# Altium schematic sheet Схема проверки шлейфа.SchDoc
size 594 x 420 mm; CheckedBy: Проверил; SheetNumber: 1; SheetTotal: 2; _Razrabotal: Рябышев; _Naimenovanie1: Стенд проверки шлейфов; _Naimenovanie4: v1.0; _Predprijatie: ООО "ПРОТОН"; _List: 1; _Listov: 2
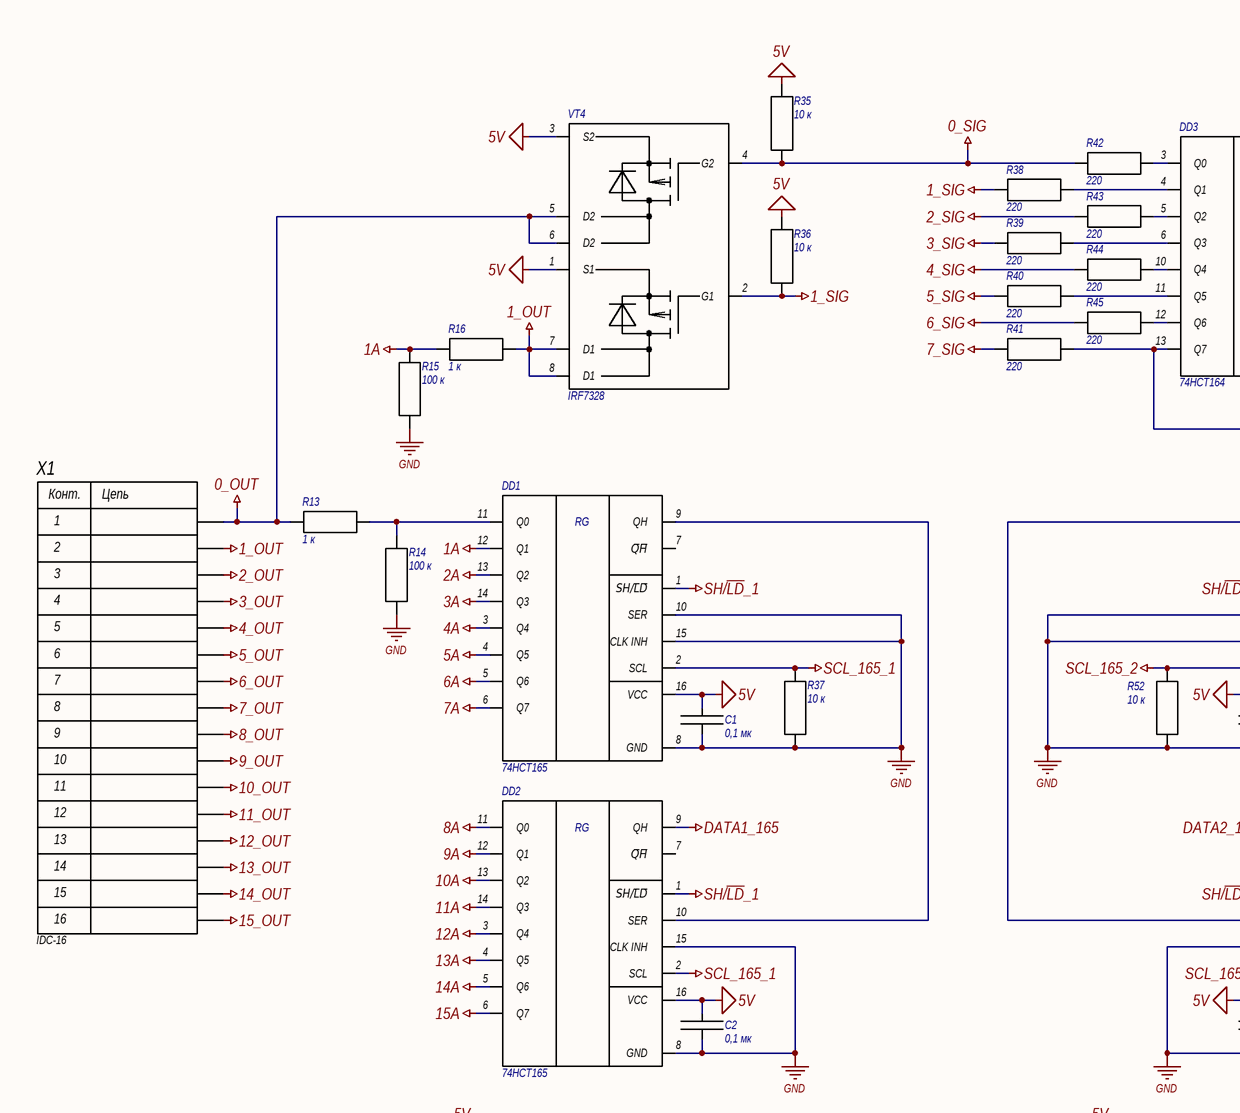
[diagram p0: Схема проверки шлейфа.SchDoc, top left]
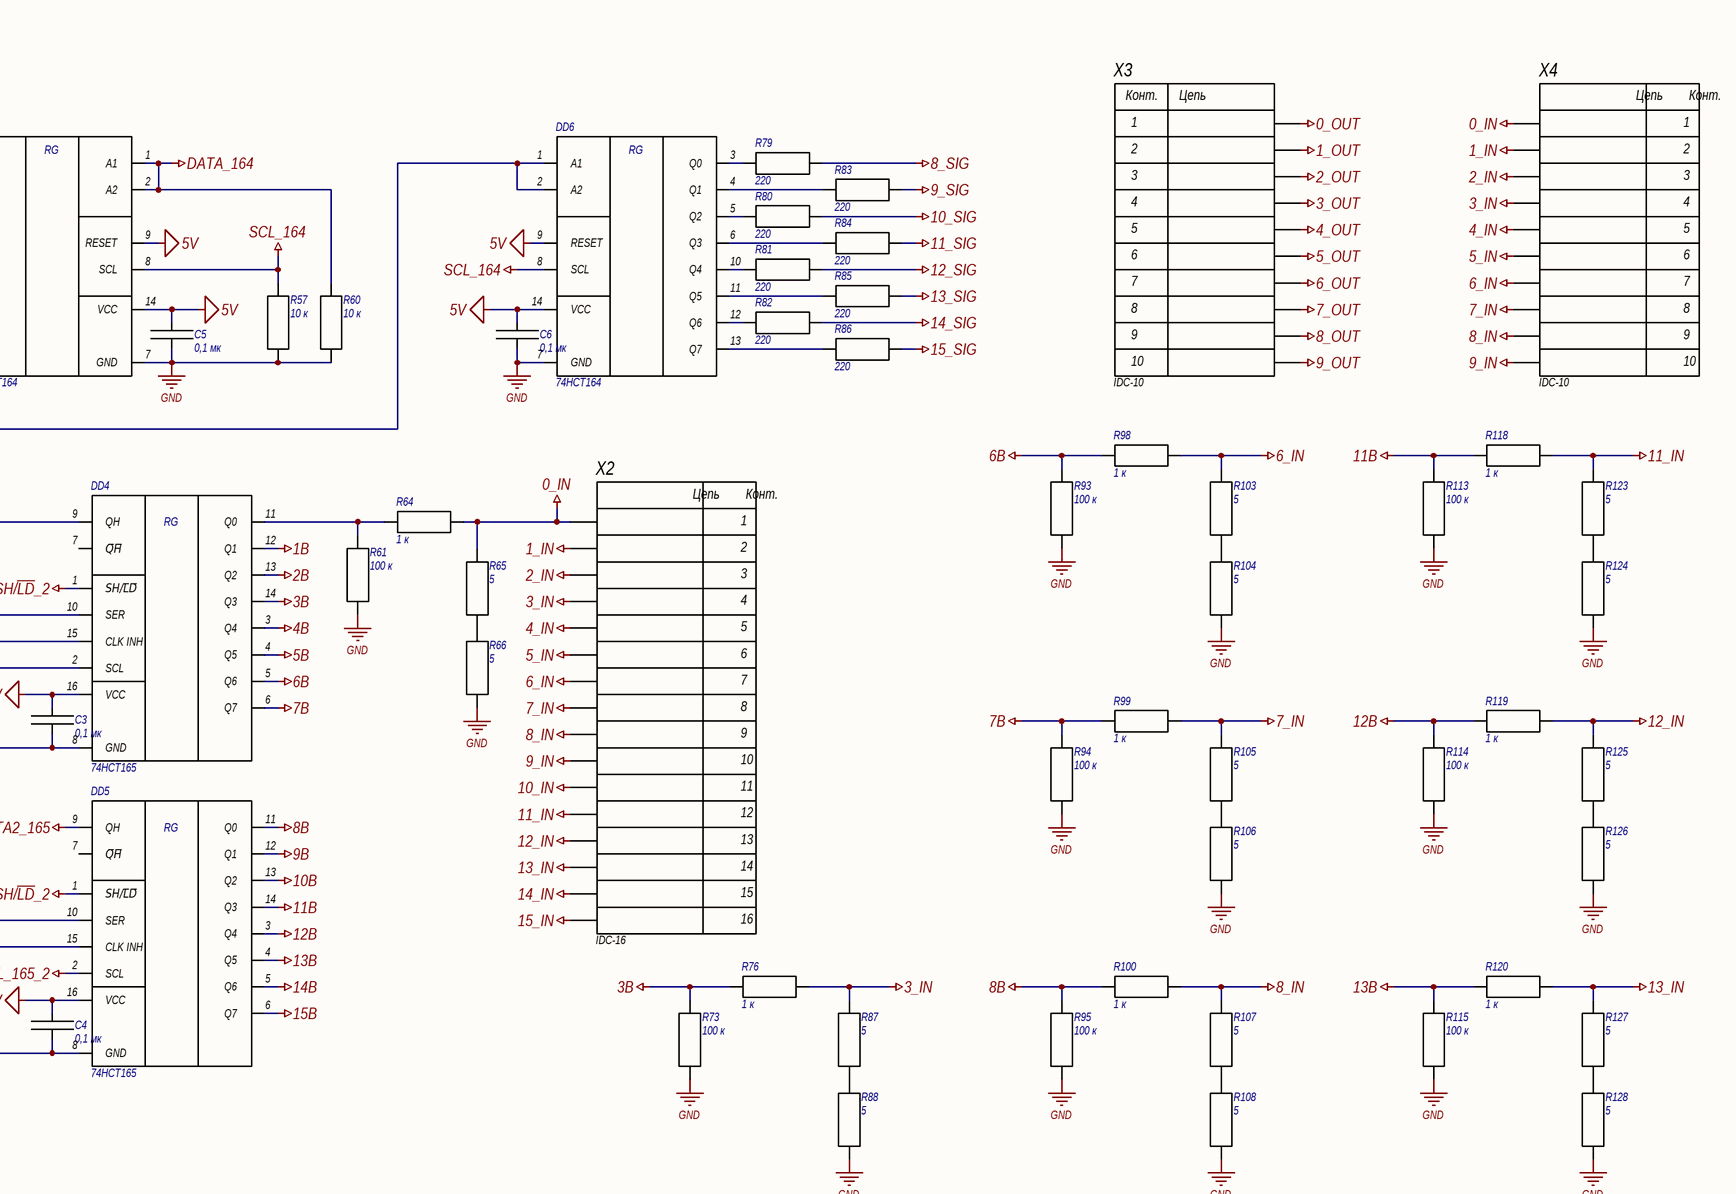
[diagram p1: Схема проверки шлейфа.SchDoc, top right]
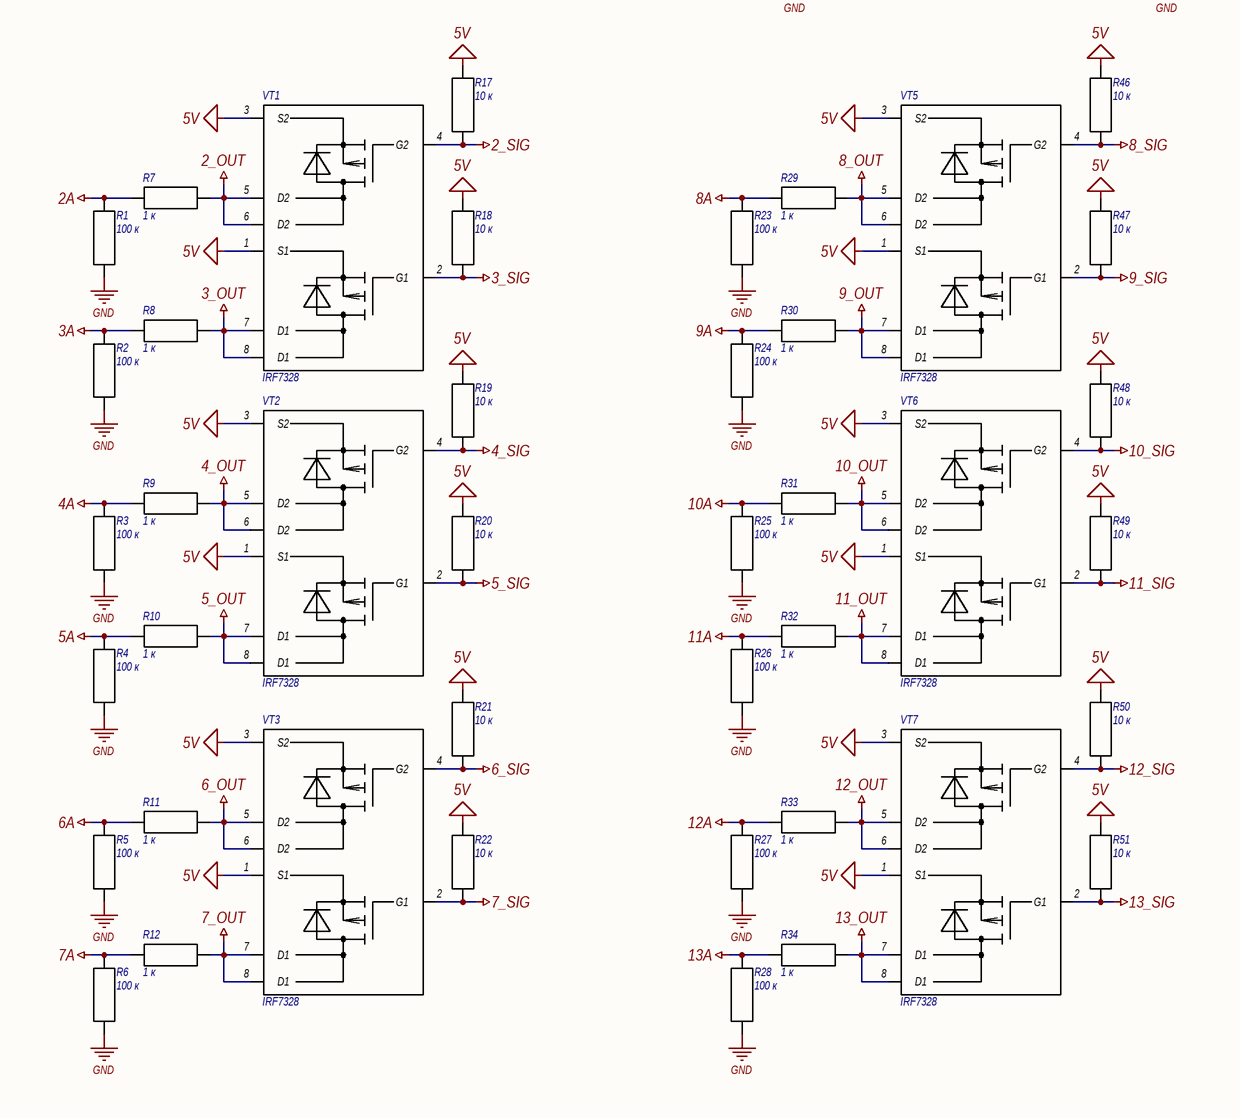
[diagram p2: Схема проверки шлейфа.SchDoc, bottom left]
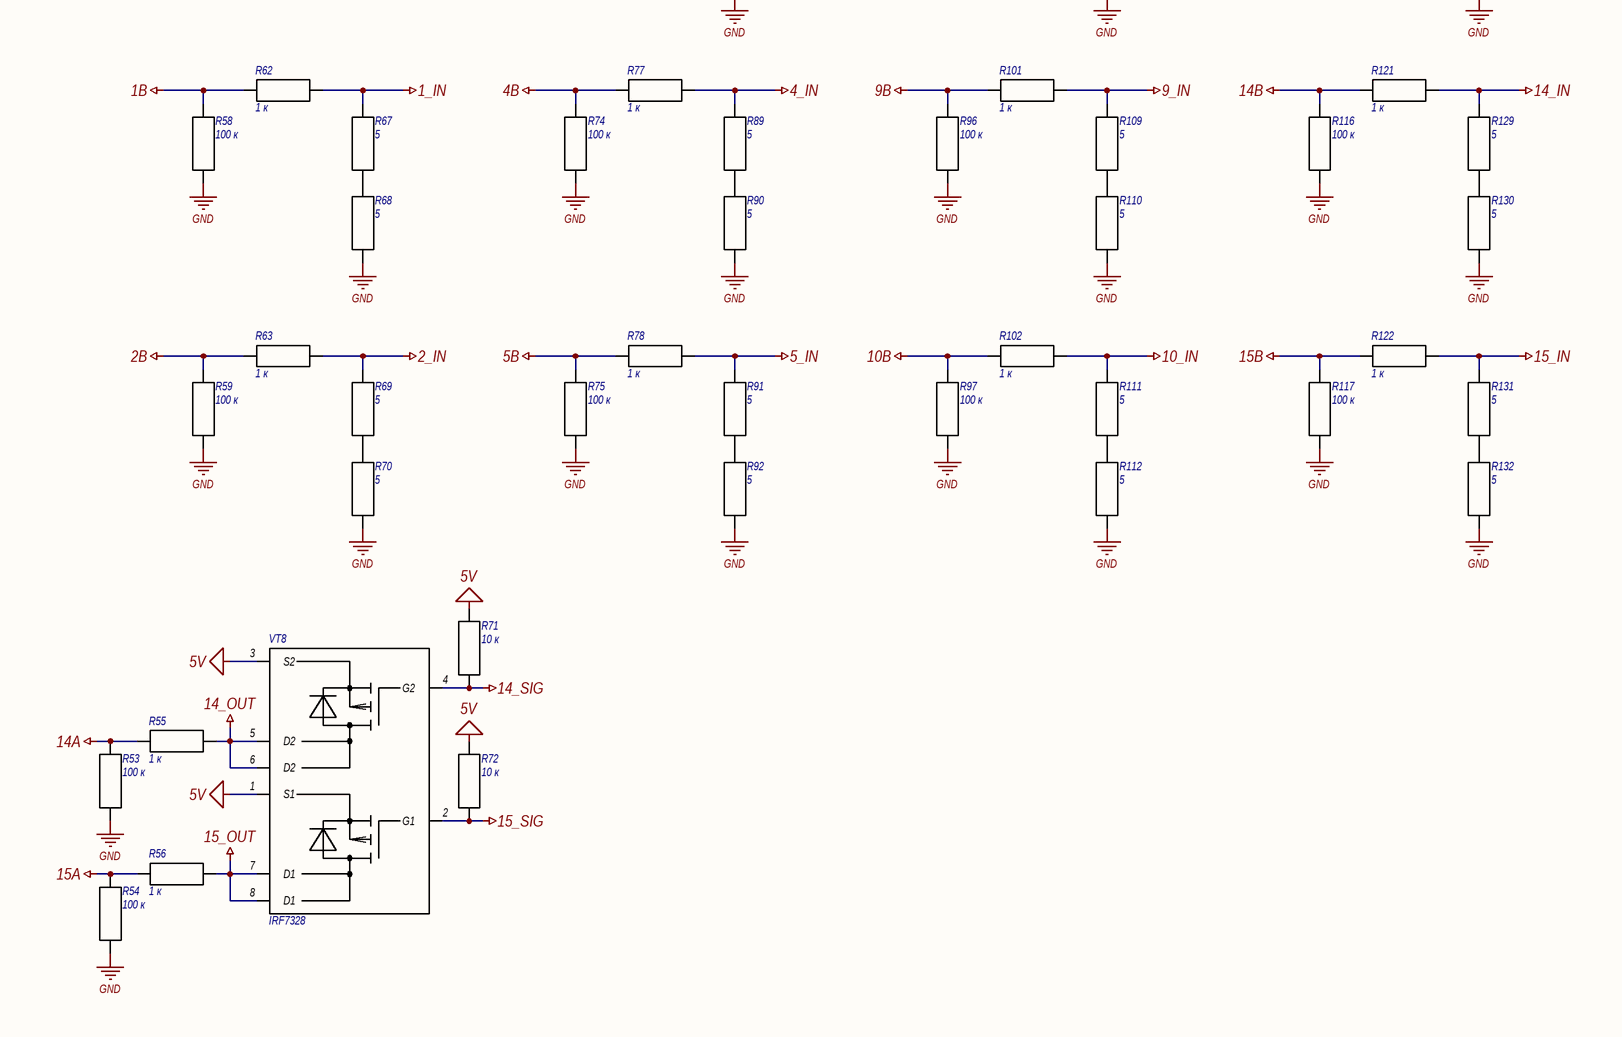
[diagram p3: Схема проверки шлейфа.SchDoc, bottom right]

## Parts
C1  0,1 мк  [CCAP0603]
C2  0,1 мк  [CCAP0603]
C3  0,1 мк  [CCAP0603]
C4  0,1 мк  [CCAP0603]
C5  0,1 мк  [CCAP0603]
C6  0,1 мк  [CCAP0603]
DD1  74HCT165  [SOIC16 9.9x3.9]
DD2  74HCT165  [SOIC16 9.9x3.9]
DD3  74HCT164  [SOIC14 8.6x3.9]
DD4  74HCT165  [SOIC16 9.9x3.9]
DD5  74HCT165  [SOIC16 9.9x3.9]
DD6  74HCT164  [SOIC14 8.6x3.9]
R1  100 к  [RES0805]
R2  100 к  [RES0805]
R3  100 к  [RES0805]
R4  100 к  [RES0805]
R5  100 к  [RES0805]
R6  100 к  [RES0805]
R7  1 к  [RES0805]
R8  1 к  [RES0805]
R9  1 к  [RES0805]
R10  1 к  [RES0805]
R11  1 к  [RES0805]
R12  1 к  [RES0805]
R13  1 к  [RES0805]
R14  100 к  [RES0805]
R15  100 к  [RES0805]
R16  1 к  [RES0805]
R17  10 к  [RES0805]
R18  10 к  [RES0805]
R19  10 к  [RES0805]
R20  10 к  [RES0805]
R21  10 к  [RES0805]
R22  10 к  [RES0805]
R23  100 к  [RES0805]
R24  100 к  [RES0805]
R25  100 к  [RES0805]
R26  100 к  [RES0805]
R27  100 к  [RES0805]
R28  100 к  [RES0805]
R29  1 к  [RES0805]
R30  1 к  [RES0805]
R31  1 к  [RES0805]
R32  1 к  [RES0805]
R33  1 к  [RES0805]
R34  1 к  [RES0805]
R35  10 к  [RES0805]
R36  10 к  [RES0805]
R37  10 к  [RES0805]
R38  220  [RES0805]
R39  220  [RES0805]
R40  220  [RES0805]
R41  220  [RES0805]
R42  220  [RES0805]
R43  220  [RES0805]
R44  220  [RES0805]
R45  220  [RES0805]
R46  10 к  [RES0805]
R47  10 к  [RES0805]
R48  10 к  [RES0805]
R49  10 к  [RES0805]
R50  10 к  [RES0805]
R51  10 к  [RES0805]
R52  10 к  [RES0603]
R53  100 к  [RES0805]
R54  100 к  [RES0805]
R55  1 к  [RES0805]
R56  1 к  [RES0805]
R57  10 к  [RES0805]
R58  100 к  [RES0603]
R59  100 к  [RES0603]
R60  10 к  [RES0805]
R61  100 к  [RES0603]
R62  1 к  [RES0603]
R63  1 к  [RES0603]
R64  1 к  [RES0603]
R65  5  [RES2512]
R66  5  [RES2512]
R67  5  [RES2512]
R68  5  [RES2512]
R69  5  [RES2512]
R70  5  [RES2512]
R71  10 к  [RES0805]
R72  10 к  [RES0805]
R73  100 к  [RES0603]
R74  100 к  [RES0603]
R75  100 к  [RES0603]
R76  1 к  [RES0603]
R77  1 к  [RES0603]
R78  1 к  [RES0603]
R79  220  [RES0805]
R80  220  [RES0805]
R81  220  [RES0805]
R82  220  [RES0805]
R83  220  [RES0805]
R84  220  [RES0805]
R85  220  [RES0805]
R86  220  [RES0805]
R87  5  [RES2512]
R88  5  [RES2512]
R89  5  [RES2512]
R90  5  [RES2512]
R91  5  [RES2512]
R92  5  [RES2512]
R93  100 к  [RES0603]
R94  100 к  [RES0603]
R95  100 к  [RES0603]
R96  100 к  [RES0603]
R97  100 к  [RES0603]
R98  1 к  [RES0603]
R99  1 к  [RES0603]
R100  1 к  [RES0603]
R101  1 к  [RES0603]
R102  1 к  [RES0603]
R103  5  [RES2512]
R104  5  [RES2512]
R105  5  [RES2512]
R106  5  [RES2512]
R107  5  [RES2512]
R108  5  [RES2512]
R109  5  [RES2512]
R110  5  [RES2512]
R111  5  [RES2512]
R112  5  [RES2512]
R113  100 к  [RES0603]
R114  100 к  [RES0603]
R115  100 к  [RES0603]
R116  100 к  [RES0603]
R117  100 к  [RES0603]
R118  1 к  [RES0603]
R119  1 к  [RES0603]
R120  1 к  [RES0603]
R121  1 к  [RES0603]
R122  1 к  [RES0603]
R123  5  [RES2512]
R124  5  [RES2512]
R125  5  [RES2512]
R126  5  [RES2512]
R127  5  [RES2512]
R128  5  [RES2512]
R129  5  [RES2512]
R130  5  [RES2512]
R131  5  [RES2512]
R132  5  [RES2512]
VT1  IRF7328  [SOIC8 4.9x3.9]
VT2  IRF7328  [SOIC8 4.9x3.9]
VT3  IRF7328  [SOIC8 4.9x3.9]
VT4  IRF7328  [SOIC8 4.9x3.9]
VT5  IRF7328  [SOIC8 4.9x3.9]
VT6  IRF7328  [SOIC8 4.9x3.9]
VT7  IRF7328  [SOIC8 4.9x3.9]
VT8  IRF7328  [SOIC8 4.9x3.9]
X1  IDC-16  [IDC-16]
X2  IDC-16  [IDC-16]
X3  IDC-10  [IDC-10]
X4  IDC-10  [IDC-10]

## Nets
0_IN: R64.1 R65.1 X2.1 X4.1
0_OUT: R13.1 VT4.5(D2) VT4.6(D2) X1.1 X3.1
0_SIG: R35.1 R42.1 VT4.4(G2)
1_IN: R62.1 R67.1 X2.2 X4.2
1_OUT: R16.1 VT4.7(D1) VT4.8(D1) X1.2 X3.2
1_SIG: R36.1 R38.1 VT4.2(G1)
1А: DD1.12(Q1) R15.1 R16.2
1В: DD4.12(Q1) R58.1 R62.2
2_IN: R63.1 R69.1 X2.3 X4.3
2_OUT: R7.1 VT1.5(D2) VT1.6(D2) X1.3 X3.3
2_SIG: R17.1 R43.1 VT1.4(G2)
2А: DD1.13(Q2) R1.1 R7.2
2В: DD4.13(Q2) R59.1 R63.2
3_IN: R76.1 R87.1 X2.4 X4.4
3_OUT: R8.1 VT1.7(D1) VT1.8(D1) X1.4 X3.4
3_SIG: R18.1 R39.1 VT1.2(G1)
3А: DD1.14(Q3) R2.1 R8.2
3В: DD4.14(Q3) R73.1 R76.2
4_IN: R77.1 R89.1 X2.5 X4.5
4_OUT: R9.1 VT2.5(D2) VT2.6(D2) X1.5 X3.5
4_SIG: R19.1 R44.1 VT2.4(G2)
4А: DD1.3(Q4) R3.1 R9.2
4В: DD4.3(Q4) R74.1 R77.2
5_IN: R78.1 R91.1 X2.6 X4.6
5_OUT: R10.1 VT2.7(D1) VT2.8(D1) X1.6 X3.6
5_SIG: R20.1 R40.1 VT2.2(G1)
5V: C1.1 C2.1 C3.1 C4.1 C5.1 C6.1 DD1.16(VCC) DD2.16(VCC) DD3.9(RESET) DD3.14(VCC) DD4.16(VCC) DD5.16(VCC) DD6.9(RESET) DD6.14(VCC) R17.2 R18.2 R19.2 R20.2 R21.2 R22.2 R35.2 R36.2 R46.2 R47.2 R48.2 R49.2 R50.2 R51.2 R71.2 R72.2 VT1.1(S1) VT1.3(S2) VT2.1(S1) VT2.3(S2) VT3.1(S1) VT3.3(S2) VT4.1(S1) VT4.3(S2) VT5.1(S1) VT5.3(S2) VT6.1(S1) VT6.3(S2) VT7.1(S1) VT7.3(S2) VT8.1(S1) VT8.3(S2)
5А: DD1.4(Q5) R4.1 R10.2
5В: DD4.4(Q5) R75.1 R78.2
6_IN: R98.1 R103.1 X2.7 X4.7
6_OUT: R11.1 VT3.5(D2) VT3.6(D2) X1.7 X3.7
6_SIG: R21.1 R45.1 VT3.4(G2)
6А: DD1.5(Q6) R5.1 R11.2
6В: DD4.5(Q6) R93.1 R98.2
7_IN: R99.1 R105.1 X2.8 X4.8
7_OUT: R12.1 VT3.7(D1) VT3.8(D1) X1.8 X3.8
7_SIG: R22.1 R41.1 VT3.2(G1)
7А: DD1.6(Q7) R6.1 R12.2
7В: DD4.6(Q7) R94.1 R99.2
8_IN: R100.1 R107.1 X2.9 X4.9
8_OUT: R29.1 VT5.5(D2) VT5.6(D2) X1.9 X3.9
8_SIG: R46.1 R79.1 VT5.4(G2)
8А: DD2.11(Q0) R23.1 R29.2
8В: DD5.11(Q0) R95.1 R100.2
9_IN: R101.1 R109.1 X2.10 X4.10
9_OUT: R30.1 VT5.7(D1) VT5.8(D1) X1.10 X3.10
9_SIG: R47.1 R83.1 VT5.2(G1)
9А: DD2.12(Q1) R24.1 R30.2
9В: DD5.12(Q1) R96.1 R101.2
10_IN: R102.1 R111.1 X2.11
10_OUT: R31.1 VT6.5(D2) VT6.6(D2) X1.11
10_SIG: R48.1 R80.1 VT6.4(G2)
10А: DD2.13(Q2) R25.1 R31.2
10В: DD5.13(Q2) R97.1 R102.2
11_IN: R118.1 R123.1 X2.12
11_OUT: R32.1 VT6.7(D1) VT6.8(D1) X1.12
11_SIG: R49.1 R84.1 VT6.2(G1)
11А: DD2.14(Q3) R26.1 R32.2
11В: DD5.14(Q3) R113.1 R118.2
12_IN: R119.1 R125.1 X2.13
12_OUT: R33.1 VT7.5(D2) VT7.6(D2) X1.13
12_SIG: R50.1 R81.1 VT7.4(G2)
12А: DD2.3(Q4) R27.1 R33.2
12В: DD5.3(Q4) R114.1 R119.2
13_IN: R120.1 R127.1 X2.14
13_OUT: R34.1 VT7.7(D1) VT7.8(D1) X1.14
13_SIG: R51.1 R85.1 VT7.2(G1)
13А: DD2.4(Q5) R28.1 R34.2
13В: DD5.4(Q5) R115.1 R120.2
14_IN: R121.1 R129.1 X2.15
14_OUT: R55.1 VT8.5(D2) VT8.6(D2) X1.15
14_SIG: R71.1 R82.1 VT8.4(G2)
14А: DD2.5(Q6) R53.1 R55.2
14В: DD5.5(Q6) R116.1 R121.2
15_IN: R122.1 R131.1 X2.16
15_OUT: R56.1 VT8.7(D1) VT8.8(D1) X1.16
15_SIG: R72.1 R86.1 VT8.2(G1)
15А: DD2.6(Q7) R54.1 R56.2
15В: DD5.6(Q7) R117.1 R122.2
DATA1_165: DD2.9(QH)
DATA2_165: DD5.9(QH)
DATA_164: DD3.1(A1) DD3.2(A2) R60.2
GND: C1.2 C2.2 C3.2 C4.2 C5.2 C6.2 DD1.8(GND) DD1.10(SER) DD1.15(CLK_INH) DD2.8(GND) DD2.15(CLK_INH) DD3.7(GND) DD4.8(GND) DD4.10(SER) DD4.15(CLK_INH) DD5.8(GND) DD5.15(CLK_INH) DD6.7(GND) R1.2 R2.2 R3.2 R4.2 R5.2 R6.2 R14.2 R15.2 R23.2 R24.2 R25.2 R26.2 R27.2 R28.2 R37.1 R52.1 R53.2 R54.2 R57.1 R58.2 R59.2 R60.1 R61.2 R66.2 R68.2 R70.2 R73.2 R74.2 R75.2 R88.2 R90.2 R92.2 R93.2 R94.2 R95.2 R96.2 R97.2 R104.2 R106.2 R108.2 R110.2 R112.2 R113.2 R114.2 R115.2 R116.2 R117.2 R124.2 R126.2 R128.2 R130.2 R132.2
SCL_164: DD3.8(SCL) DD6.8(SCL) R57.2
SCL_165_1: DD1.2(SCL) DD2.2(SCL) R37.2
SCL_165_2: DD4.2(SCL) DD5.2(SCL) R52.2
SH/~{LD}_1: DD1.1(SH/L̅D̅) DD2.1(SH/L̅D̅)
SH/~{LD}_2: DD4.1(SH/L̅D̅) DD5.1(SH/L̅D̅)
NetDD1_9: DD1.9(QH) DD2.10(SER)
NetDD1_11: DD1.11(Q0) R13.2 R14.1
NetDD3_3: DD3.3(Q0) R42.2
NetDD3_4: DD3.4(Q1) R38.2
NetDD3_5: DD3.5(Q2) R43.2
NetDD3_6: DD3.6(Q3) R39.2
NetDD3_10: DD3.10(Q4) R44.2
NetDD3_11: DD3.11(Q5) R40.2
NetDD3_12: DD3.12(Q6) R45.2
NetDD3_13: DD3.13(Q7) DD6.1(A1) DD6.2(A2) R41.2
NetDD4_9: DD4.9(QH) DD5.10(SER)
NetDD4_11: DD4.11(Q0) R61.1 R64.2
NetDD6_3: DD6.3(Q0) R79.2
NetDD6_4: DD6.4(Q1) R83.2
NetDD6_5: DD6.5(Q2) R80.2
NetDD6_6: DD6.6(Q3) R84.2
NetDD6_10: DD6.10(Q4) R81.2
NetDD6_11: DD6.11(Q5) R85.2
NetDD6_12: DD6.12(Q6) R82.2
NetDD6_13: DD6.13(Q7) R86.2
NetR65_2: R65.2 R66.1
NetR67_2: R67.2 R68.1
NetR69_2: R69.2 R70.1
NetR87_2: R87.2 R88.1
NetR89_2: R89.2 R90.1
NetR91_2: R91.2 R92.1
NetR103_2: R103.2 R104.1
NetR105_2: R105.2 R106.1
NetR107_2: R107.2 R108.1
NetR109_2: R109.2 R110.1
NetR111_2: R111.2 R112.1
NetR123_2: R123.2 R124.1
NetR125_2: R125.2 R126.1
NetR127_2: R127.2 R128.1
NetR129_2: R129.2 R130.1
NetR131_2: R131.2 R132.1

Not connected (* = marked no-connect by the designer): DD1 7(Q̅H̅); DD2 7(Q̅H̅); DD4 7(Q̅H̅); DD5 7(Q̅H̅)

## Notes on the sheet
- Перв. примен.
- Справ. №
- Подп. и дата
- Инв. № дубл.
- Взам. инв. №
- Разраб.
- Изм.
- Лист
- № докум.
- Подп.
- Дата
- Лит.
- Масса
- Масштаб
- Пров.
- Т.контр.
- Листов
- Инв. № подл.
- Утв.
- Н.контр.
- Копировал
- Формат  A2
- (in symbol 16_Pin) Конт.; Цепь
- (in symbol 74HC164) RG
- (in symbol 74HC165) RG
- (in symbol IDC-10) Конт.; Цепь

## Library data of the parts
C1-C6 = Конденсатор: C0603 0,1 мкФ 50В X7R
DD1 DD2 DD4 DD5 = 74HC165: 74HCT165D (SOIC-16) /
DD3 DD6 = 74HC164: 74HCT164D (SOIC-14)
R1-R6 R14 R15 R23-R28 R53 R54 = Резистор: R0805 100 кОм ±5%
R7-R13 R16 R29-R34 R55 R56 = Резистор: R0805 1 кОм ±5%
R17-R22 R35-R37 R46-R51 R57 R60 R71 R72 = Резистор: R0805 10 кОм ±5%
R38-R45 R79-R86 = Резистор: R0805 220 Ом ±5%
R52 = Резистор: R0603 10 кОм ±5%
R58 R59 R61 R73-R75 R93-R97 R113-R117 = Резистор: R0603 100 кОм ±5%
R62-R64 R76-R78 R98-R102 R118-R122 = Резистор: R0603 1 кОм ±5%
R65-R70 R87-R92 R103-R112 R123-R132 = Резистор: R2512 5 Ом ±5%
VT1-VT8 = IRF7342: IRF7328 (SOP-8)
X1 X2 = 16_Pin: Value: Pad; HelpURL: *; Price: *
X3 X4 = IDC-10: Value: IDC-10